# Altium project Stepper-Driver-v2.0.PrjPcb (part 5 of 5)
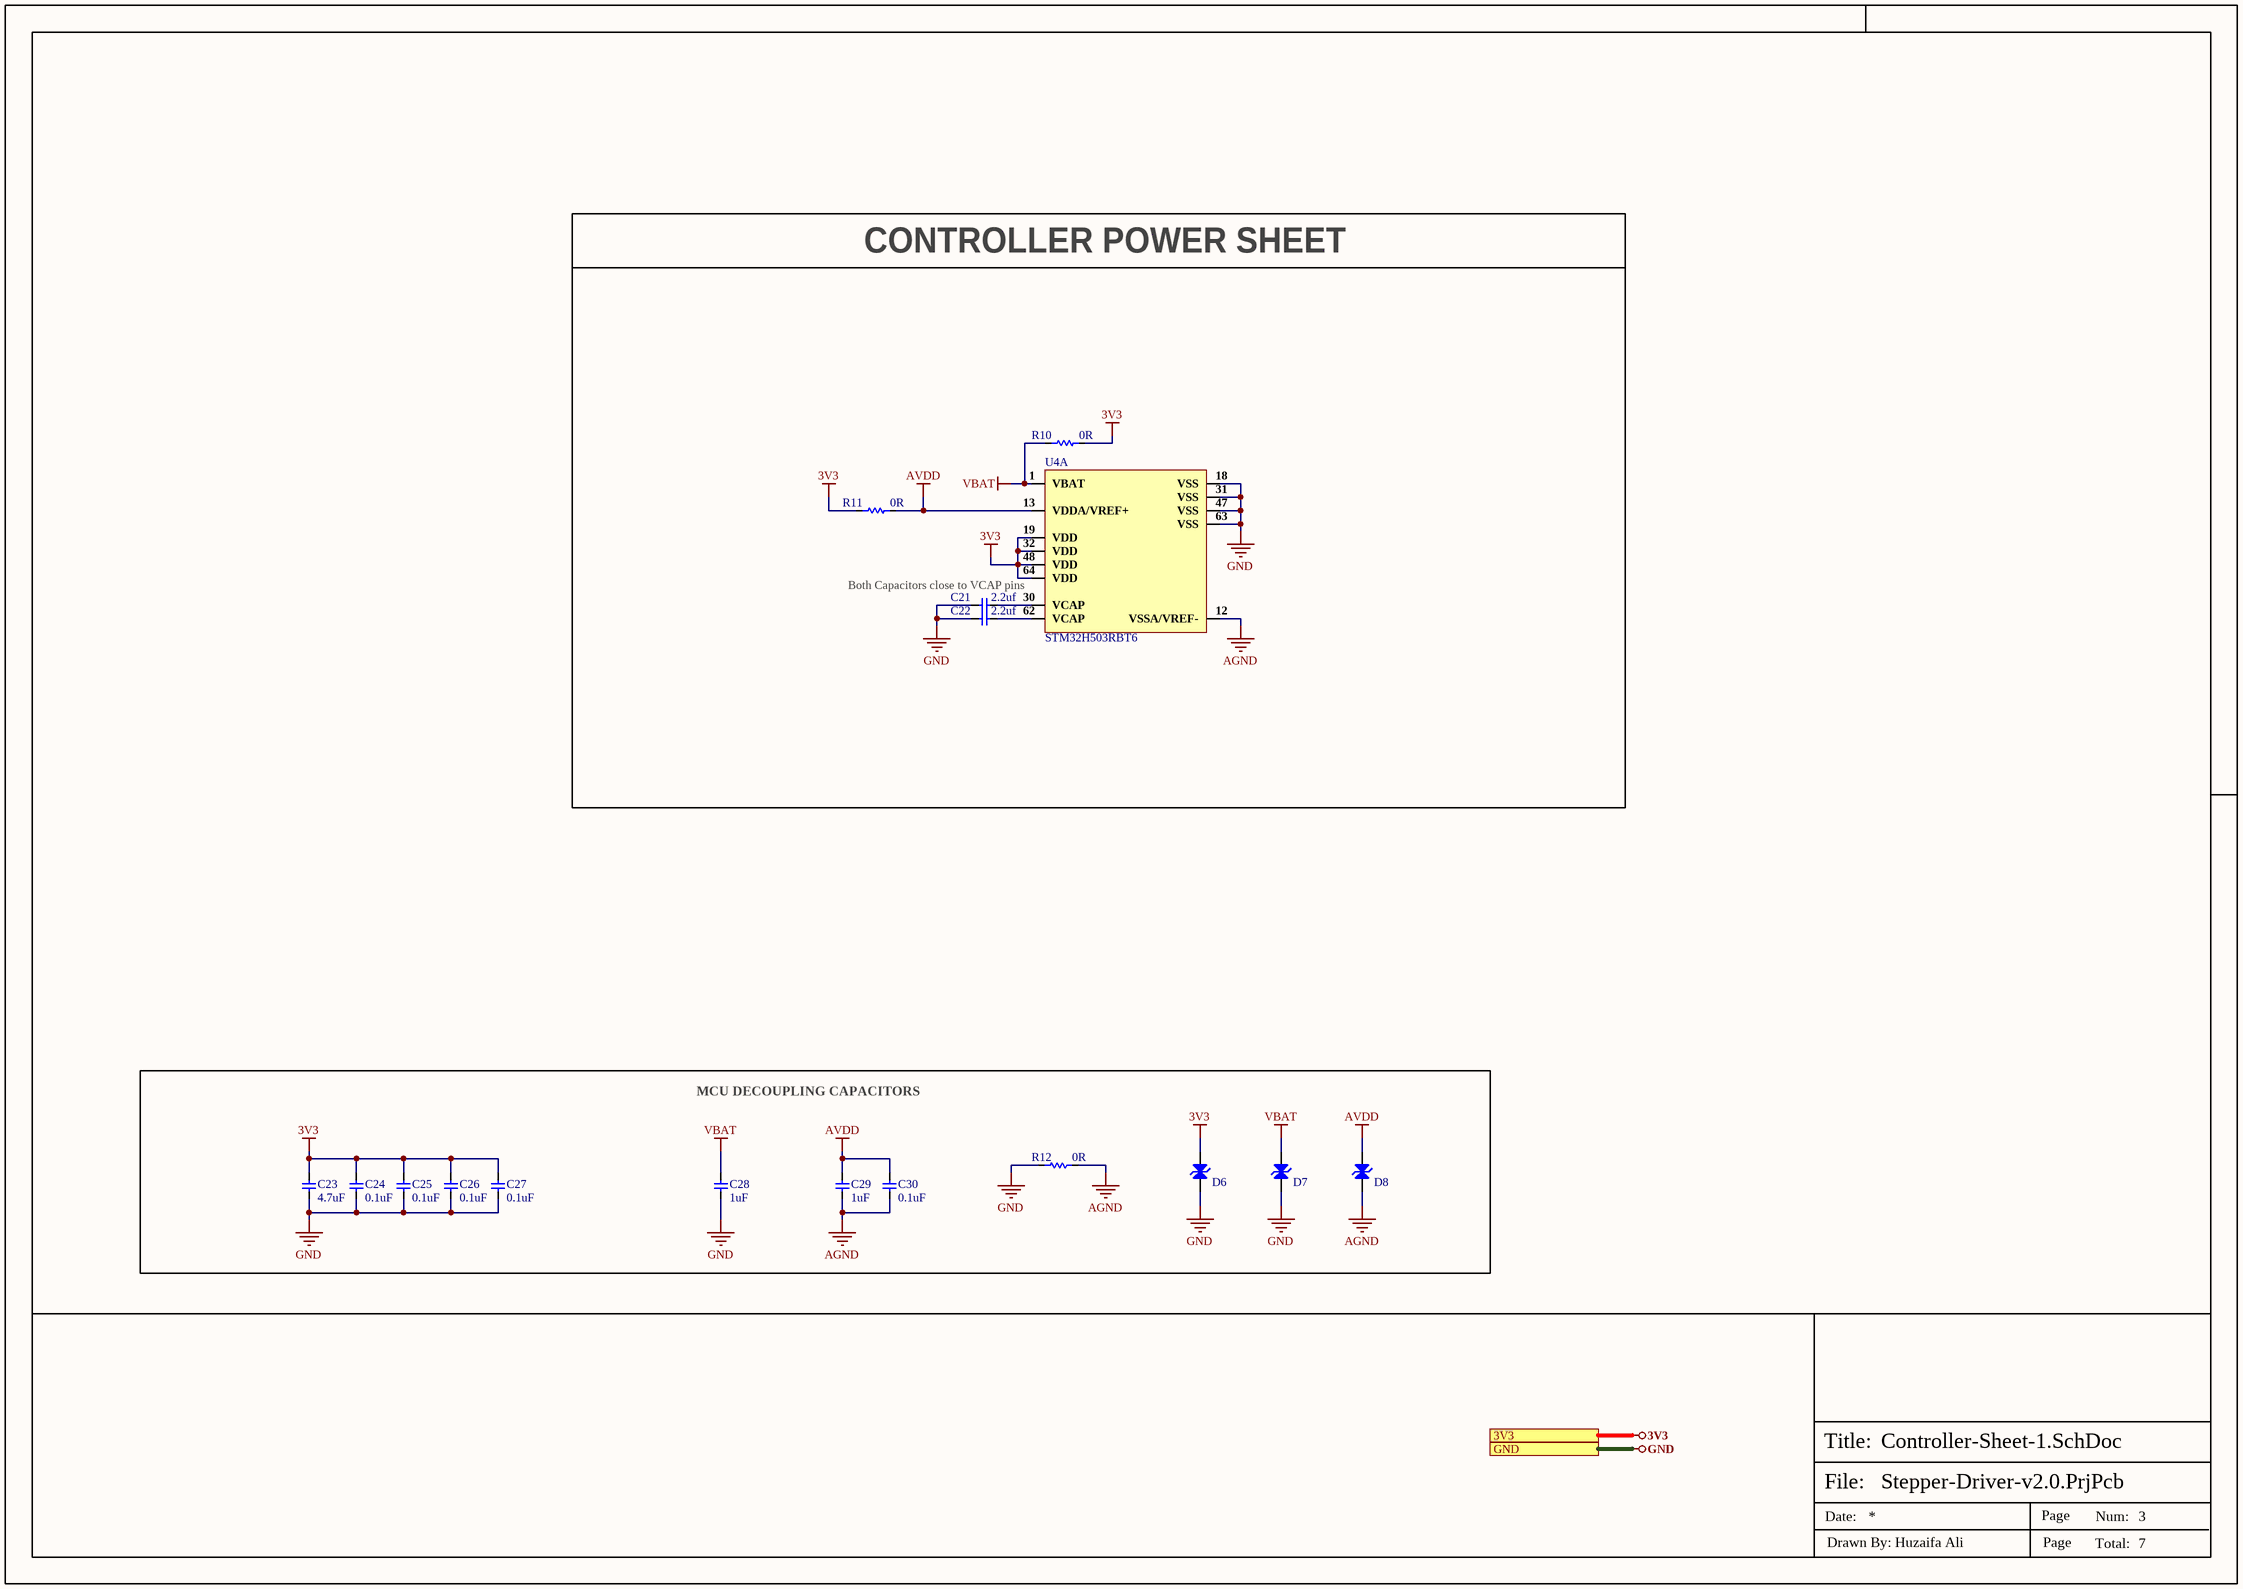
[diagram p7: Controller-Sheet-1.SchDoc]

## Nets that join several sheets
3V3: Controller-Sheet-2 (12 pins), USB-Sheet (R72.2 R73.2 R74.2 R75.2), Comms-Sheet (7 pins), Stepper-Driver-Sheet (13 pins), Power-Sheet (D5.2 F1.2 R9.1), Controller-Sheet-1 (12 pins)
5V: Controller-Sheet-2 (R65.2), USB-Sheet (U6.5), Comms-Sheet (10 pins), Power-Sheet (13 pins)
24V: Stepper-Driver-Sheet (52 pins), Power-Sheet (13 pins)
GND: Controller-Sheet-2 (21 pins), USB-Sheet (13 pins), Comms-Sheet (22 pins), Stepper-Driver-Sheet (67 pins), Power-Sheet (34 pins), Controller-Sheet-1 (15 pins)
SHGND: USB-Sheet (J5.S1 J5.S2 J5.S3 J5.S4), Power-Sheet (J2.3)
485_DIN_1: Controller-Sheet-2 (R20.2), Comms-Sheet (U9.4)
485_ROUT_1: Controller-Sheet-2 (R18.2), Comms-Sheet (U9.1)
ADC_SCL: Controller-Sheet-2 (R33.1 R71.2 U5.12), Stepper-Driver-Sheet (U30.10)
ADC_SDA: Controller-Sheet-2 (R31.1 R70.2 U5.13), Stepper-Driver-Sheet (U30.9)
BEMF-ADC-RDY: Controller-Sheet-2 (R21.1), Stepper-Driver-Sheet (R129.2 U30.2)
CAN1_RXD: Controller-Sheet-2 (R40.1), Comms-Sheet (R89.1)
CAN1_SHDN: Controller-Sheet-2 (U5.2), Comms-Sheet (R92.1)
CAN1_STB: Controller-Sheet-2 (U5.1), Comms-Sheet (R83.1)
CAN1_TXD: Controller-Sheet-2 (R42.1), Comms-Sheet (R84.1)
DI_PA3: Controller-Sheet-2 (R22.2), Stepper-Driver-Sheet (R109.2 U18.18)
DI_PA4: Controller-Sheet-2 (R24.2), Stepper-Driver-Sheet (R111.2 U18.19)
DI_PA5: Controller-Sheet-2 (R26.2), Stepper-Driver-Sheet (R110.2 U19.18)
DI_PA6: Controller-Sheet-2 (R28.2), Stepper-Driver-Sheet (R112.2 U19.19)
DI_PA7: Controller-Sheet-2 (R30.2), Stepper-Driver-Sheet (R123.2 U28.18)
DI_PA8: Controller-Sheet-2 (R32.2), Stepper-Driver-Sheet (R125.2 U28.19)
DI_PB10: Controller-Sheet-2 (R36.1), Stepper-Driver-Sheet (R124.2 U29.18)
DI_PB14: Controller-Sheet-2 (R44.1), Stepper-Driver-Sheet (R126.2 U29.19)
DIR-1: Controller-Sheet-2 (R29.1), Stepper-Driver-Sheet (U18.11)
DIR-2: Controller-Sheet-2 (R46.1), Stepper-Driver-Sheet (U19.11)
DIR-3: Controller-Sheet-2 (R53.2), Stepper-Driver-Sheet (U28.11)
DIR-4: Controller-Sheet-2 (R50.1), Stepper-Driver-Sheet (U29.11)
DO_PB1: Controller-Sheet-2 (R19.1), Comms-Sheet (R97.1 U9.2 U9.3)
DO_PC10: Controller-Sheet-2 (R58.2), Stepper-Driver-Sheet (U19.16)
DO_PC11: Controller-Sheet-2 (R59.2), Stepper-Driver-Sheet (U28.16)
DO_PC13: Controller-Sheet-2 (R62.2), Stepper-Driver-Sheet (U29.16)
EXP_DO_PA0: Controller-Sheet-2 (U5.21), Stepper-Driver-Sheet (U18.8)
EXP_DO_PA1: Controller-Sheet-2 (U5.22), Stepper-Driver-Sheet (U18.9)
EXP_DO_PA2: Controller-Sheet-2 (U5.23), Stepper-Driver-Sheet (U19.8)
EXP_DO_PA3: Controller-Sheet-2 (U5.24), Stepper-Driver-Sheet (U19.9)
EXP_DO_PA4: Controller-Sheet-2 (U5.25), Stepper-Driver-Sheet (U28.8)
EXP_DO_PA5: Controller-Sheet-2 (U5.26), Stepper-Driver-Sheet (U28.9)
EXP_DO_PA6: Controller-Sheet-2 (U5.27), Stepper-Driver-Sheet (U29.8)
EXP_DO_PA7: Controller-Sheet-2 (U5.28), Stepper-Driver-Sheet (U29.9)
LED1_DIN: Controller-Sheet-2 (R68.2), Comms-Sheet (LED6.4)
LPTIM1_CH1_PC12: Controller-Sheet-2 (R60.2), Stepper-Driver-Sheet (U29.10)
SPI1_MISO: Controller-Sheet-2 (R49.2), Stepper-Driver-Sheet (8 pins)
SPI1_MOSI: Controller-Sheet-2 (R51.2), Stepper-Driver-Sheet (U18.15 U19.15 U28.15 U29.15)
SPI1_NSS: Controller-Sheet-2 (R48.2), Stepper-Driver-Sheet (U18.16)
SPI1_SCK: Controller-Sheet-2 (R47.2), Stepper-Driver-Sheet (U18.14 U19.14 U28.14 U29.14)
STEP-1: Controller-Sheet-2 (R54.2), Stepper-Driver-Sheet (U18.10)
STEP-2: Controller-Sheet-2 (R45.2), Stepper-Driver-Sheet (U19.10)
STEP-3: Controller-Sheet-2 (R16.2), Stepper-Driver-Sheet (U28.10)
USB_FS_N: Controller-Sheet-2 (R38.2), USB-Sheet (U7.1)
USB_FS_OVCR: Controller-Sheet-2 (R35.2), USB-Sheet (LED4.2 R73.1 U6.3)
USB_FS_P: Controller-Sheet-2 (R39.2), USB-Sheet (U7.3)
USB_FS_PWR_EN: Controller-Sheet-2 (R34.2), USB-Sheet (R75.1 U6.4)
VBUS_DET: Controller-Sheet-2 (R52.2), USB-Sheet (R77.1 R79.2)